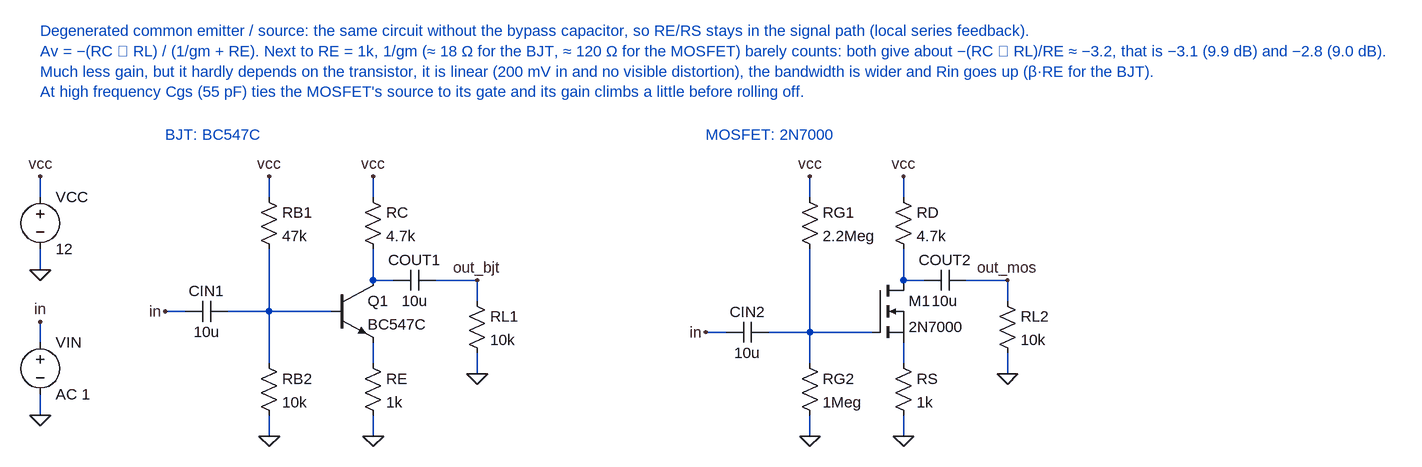
[diagram p0: schematic ced.asc]
ced.asc, the LTspice schematic file:
Version 4
SHEET 1 1600 800
WIRE -448 0 -448 32
WIRE -448 112 -448 144
WIRE -448 224 -448 256
WIRE -448 336 -448 368
WIRE 64 0 64 32
WIRE 64 112 64 160
WIRE 64 256 64 288
WIRE 64 368 64 400
WIRE -96 0 -96 32
WIRE -96 112 -96 208
WIRE -96 208 -96 288
WIRE -96 208 0 208
WIRE -96 368 -96 400
WIRE -160 208 -96 208
WIRE -256 208 -224 208
WIRE 64 160 96 160
WIRE 160 160 224 160
WIRE 224 160 224 192
WIRE 224 272 224 304
WIRE 880 0 880 32
WIRE 880 112 880 160
WIRE 880 256 880 288
WIRE 880 368 880 400
WIRE 736 0 736 32
WIRE 736 112 736 240
WIRE 736 240 736 288
WIRE 736 240 832 240
WIRE 736 368 736 400
WIRE 672 240 736 240
WIRE 576 240 608 240
WIRE 880 160 912 160
WIRE 976 160 1040 160
WIRE 1040 160 1040 192
WIRE 1040 272 1040 304
FLAG -448 0 vcc
FLAG -448 144 0
FLAG -448 224 in
FLAG -448 368 0
FLAG 64 0 vcc
FLAG 64 400 0
FLAG -96 0 vcc
FLAG -96 400 0
FLAG -256 208 in
FLAG 224 160 out_bjt
FLAG 224 304 0
FLAG 880 0 vcc
FLAG 880 400 0
FLAG 736 0 vcc
FLAG 736 400 0
FLAG 576 240 in
FLAG 1040 160 out_mos
FLAG 1040 304 0
SYMBOL voltage -448 16 R0
SYMATTR InstName VCC
SYMATTR Value 12
SYMBOL voltage -448 240 R0
SYMATTR InstName VIN
SYMATTR Value AC 1
SYMBOL npn 0 160 R0
SYMATTR InstName Q1
SYMATTR Value BC547C
SYMBOL res 48 16 R0
SYMATTR InstName RC
SYMATTR Value 4.7k
SYMBOL res 48 272 R0
SYMATTR InstName RE
SYMATTR Value 1k
SYMBOL res -112 16 R0
SYMATTR InstName RB1
SYMATTR Value 47k
SYMBOL res -112 272 R0
SYMATTR InstName RB2
SYMATTR Value 10k
SYMBOL cap -160 192 R90
WINDOW 0 0 32 VBottom 2
WINDOW 3 32 32 VTop 2
SYMATTR InstName CIN1
SYMATTR Value 10u
SYMBOL cap 160 144 R90
WINDOW 0 0 32 VBottom 2
WINDOW 3 32 32 VTop 2
SYMATTR InstName COUT1
SYMATTR Value 10u
SYMBOL res 208 176 R0
SYMATTR InstName RL1
SYMATTR Value 10k
SYMBOL nmos 832 160 R0
SYMATTR InstName M1
SYMATTR Value 2N7000
SYMBOL res 864 16 R0
SYMATTR InstName RD
SYMATTR Value 4.7k
SYMBOL res 864 272 R0
SYMATTR InstName RS
SYMATTR Value 1k
SYMBOL res 720 16 R0
SYMATTR InstName RG1
SYMATTR Value 2.2Meg
SYMBOL res 720 272 R0
SYMATTR InstName RG2
SYMATTR Value 1Meg
SYMBOL cap 672 224 R90
WINDOW 0 0 32 VBottom 2
WINDOW 3 32 32 VTop 2
SYMATTR InstName CIN2
SYMATTR Value 10u
SYMBOL cap 976 144 R90
WINDOW 0 0 32 VBottom 2
WINDOW 3 32 32 VTop 2
SYMATTR InstName COUT2
SYMATTR Value 10u
SYMBOL res 1024 176 R0
SYMATTR InstName RL2
SYMATTR Value 10k
TEXT -448 -224 Left 2 ;Degenerated common emitter / source: the same circuit without the bypass capacitor, so RE/RS stays in the signal path (local series feedback).\nAv = −(RC ∥ RL) / (1/gm + RE). Next to RE = 1k, 1/gm (≈ 18 Ω for the BJT, ≈ 120 Ω for the MOSFET) barely counts: both give about −(RC ∥ RL)/RE ≈ −3.2, that is −3.1 (9.9 dB) and −2.8 (9.0 dB).\nMuch less gain, but it hardly depends on the transistor, it is linear (200 mV in and no visible distortion), the bandwidth is wider and Rin goes up (β·RE for the BJT).\nAt high frequency Cgs (55 pF) ties the MOSFET's source to its gate and its gain climbs a little before rolling off.
TEXT -256 -64 Left 2 ;BJT: BC547C
TEXT 576 -64 Left 2 ;MOSFET: 2N7000

The netlist it stands for:
* ced.asc
VCC vcc 0 12
VIN in 0 AC 1
Q1 N001 N003 N002 0 BC547C
RC vcc N001 4.7k
RE N002 0 1k
RB1 vcc N003 47k
RB2 N003 0 10k
CIN1 N003 in 10u
COUT1 out_bjt N001 10u
RL1 out_bjt 0 10k
M1 N004 N006 N005 N005 2N7000
RD vcc N004 4.7k
RS N005 0 1k
RG1 vcc N006 2.2Meg
RG2 N006 0 1Meg
CIN2 N006 in 10u
COUT2 out_mos N004 10u
RL2 out_mos 0 10k
.model NPN NPN
.model PNP PNP
.lib standard.bjt
.model NMOS NMOS
.model PMOS PMOS
.lib standard.mos
* Degenerated common emitter / source: the same circuit without the bypass capacitor, so RE/RS stays in the signal path (local series feedback).
* Av = −(RC ∥ RL) / (1/gm + RE). Next to RE = 1k, 1/gm (≈ 18 Ω for the BJT, ≈ 120 Ω for the MOSFET) barely counts: both give about −(RC ∥ RL)/RE ≈ −3.2, that is −3.1 (9.9 dB) and −2.8 (9.0 dB).
* Much less gain, but it hardly depends on the transistor, it is linear (200 mV in and no visible distortion), the bandwidth is wider and Rin goes up (β·RE for the BJT).
* At high frequency Cgs (55 pF) ties the MOSFET's source to its gate and its gain climbs a little before rolling off.
* BJT: BC547C
* MOSFET: 2N7000
.backanno
.end